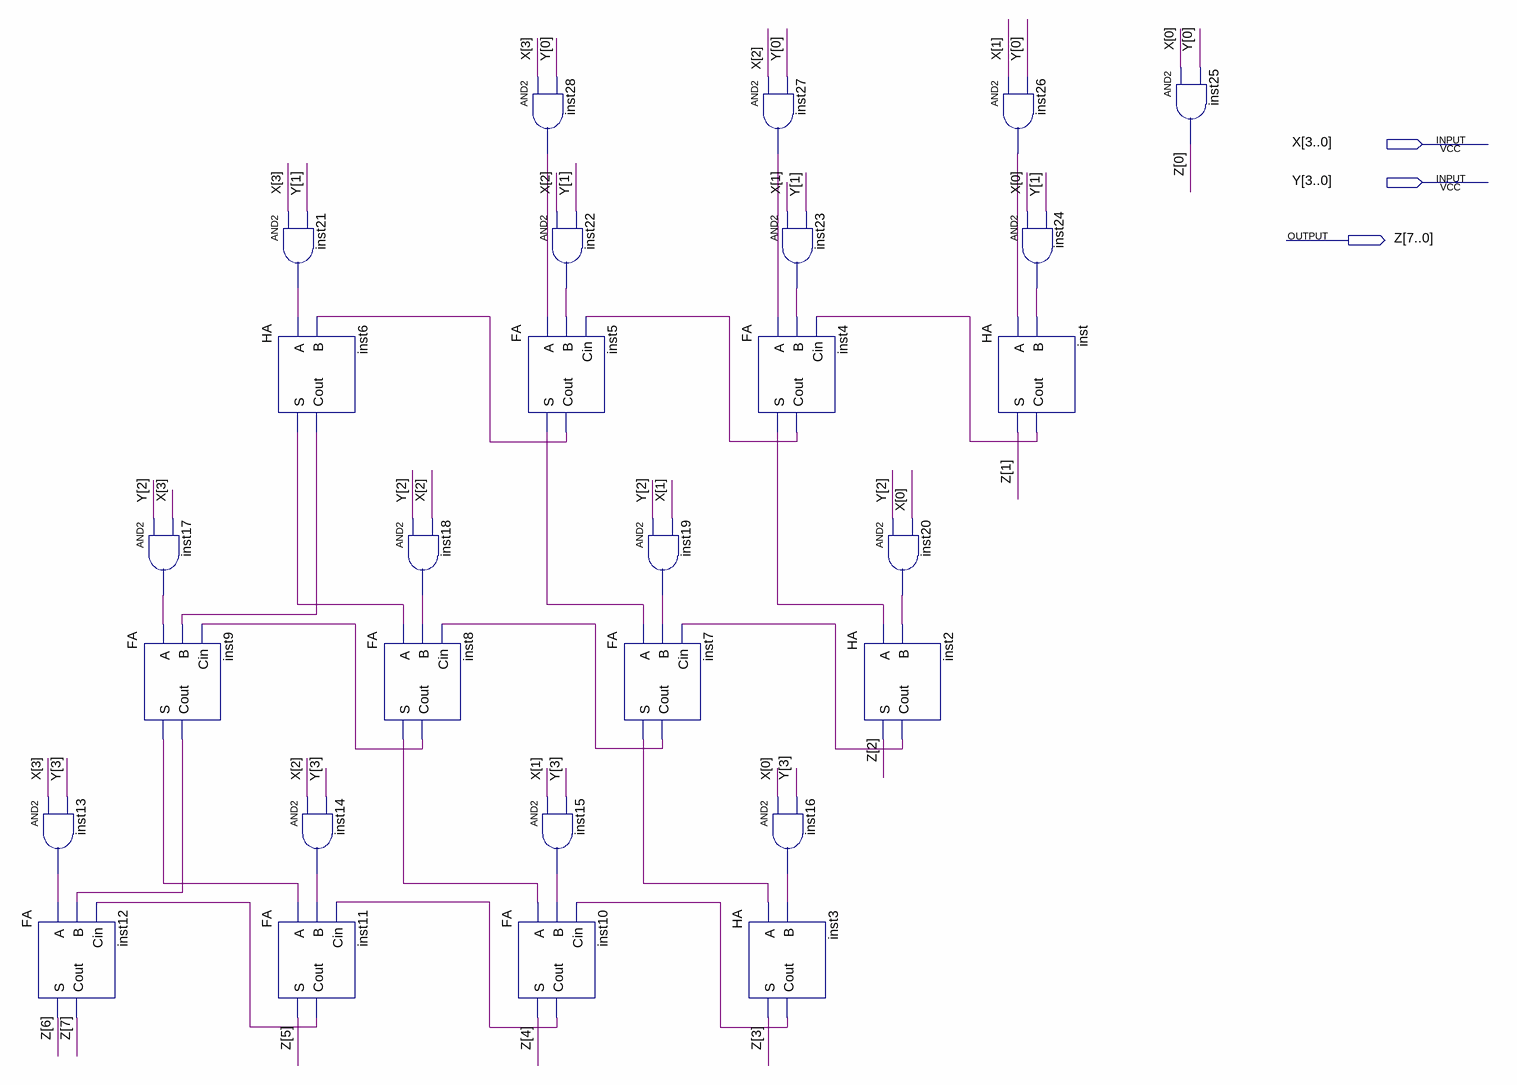
[diagram p0: schematic sheet]
// Quartus schematic MULTIPLICADOR3bits.bdf as structural Verilog: 28 symbols, 3 pins
module MULTIPLICADOR3bits (
  input  [3:0] X,
  input  [3:0] Y,
  output [7:0] Z
);

  wire inst2_cout, inst3_cout, inst4_cout, inst4_s, inst5_cout, inst5_s, inst6_cout, inst6_s, inst7_cout,
       inst7_s, inst8_cout, inst8_s, inst9_cout, inst9_s, inst10_cout, inst11_cout, inst13_out, inst14_out,
       inst15_out, inst16_out, inst17_out, inst18_out, inst19_out, inst20_out, inst21_out, inst22_out,
       inst23_out, inst24_out, inst26_out, inst27_out, inst28_out, inst_cout;

  and inst13 (inst13_out, X[3], Y[3]);
  FA inst12 (.A(inst13_out), .B(inst9_cout), .Cin(inst11_cout), .S(Z[6]), .Cout(Z[7]));
  FA inst9 (.A(inst17_out), .B(inst6_cout), .Cin(inst8_cout), .S(inst9_s), .Cout(inst9_cout));
  and inst17 (inst17_out, Y[2], X[3]);
  and inst21 (inst21_out, X[3], Y[1]);
  HA inst6 (.A(inst21_out), .B(inst5_cout), .S(inst6_s), .Cout(inst6_cout));
  FA inst11 (.A(inst9_s), .B(inst14_out), .Cin(inst10_cout), .S(Z[5]), .Cout(inst11_cout));
  and inst14 (inst14_out, X[2], Y[3]);
  and inst18 (inst18_out, Y[2], X[2]);
  FA inst8 (.A(inst6_s), .B(inst18_out), .Cin(inst7_cout), .S(inst8_s), .Cout(inst8_cout));
  FA inst5 (.A(inst28_out), .B(inst22_out), .Cin(inst4_cout), .S(inst5_s), .Cout(inst5_cout));
  FA inst10 (.A(inst8_s), .B(inst15_out), .Cin(inst3_cout), .S(Z[4]), .Cout(inst10_cout));
  and inst28 (inst28_out, X[3], Y[0]);
  and inst22 (inst22_out, X[2], Y[1]);
  and inst15 (inst15_out, X[1], Y[3]);
  and inst19 (inst19_out, Y[2], X[1]);
  FA inst7 (.A(inst5_s), .B(inst19_out), .Cin(inst2_cout), .S(inst7_s), .Cout(inst7_cout));
  FA inst4 (.A(inst27_out), .B(inst23_out), .Cin(inst_cout), .S(inst4_s), .Cout(inst4_cout));
  HA inst3 (.A(inst7_s), .B(inst16_out), .S(Z[3]), .Cout(inst3_cout));
  and inst27 (inst27_out, X[2], Y[0]);
  and inst23 (inst23_out, X[1], Y[1]);
  and inst16 (inst16_out, X[0], Y[3]);
  and inst20 (inst20_out, Y[2], X[0]);
  HA inst2 (.A(inst4_s), .B(inst20_out), .S(Z[2]), .Cout(inst2_cout));
  and inst26 (inst26_out, X[1], Y[0]);
  and inst24 (inst24_out, X[0], Y[1]);
  HA inst (.A(inst26_out), .B(inst24_out), .S(Z[1]), .Cout(inst_cout));
  and inst25 (Z[0], X[0], Y[0]);
endmodule
